# Altium schematic sheet Analog_Project_Mixer_output.SchDoc
size A4; SheetNumber: 2; SheetTotal: 2
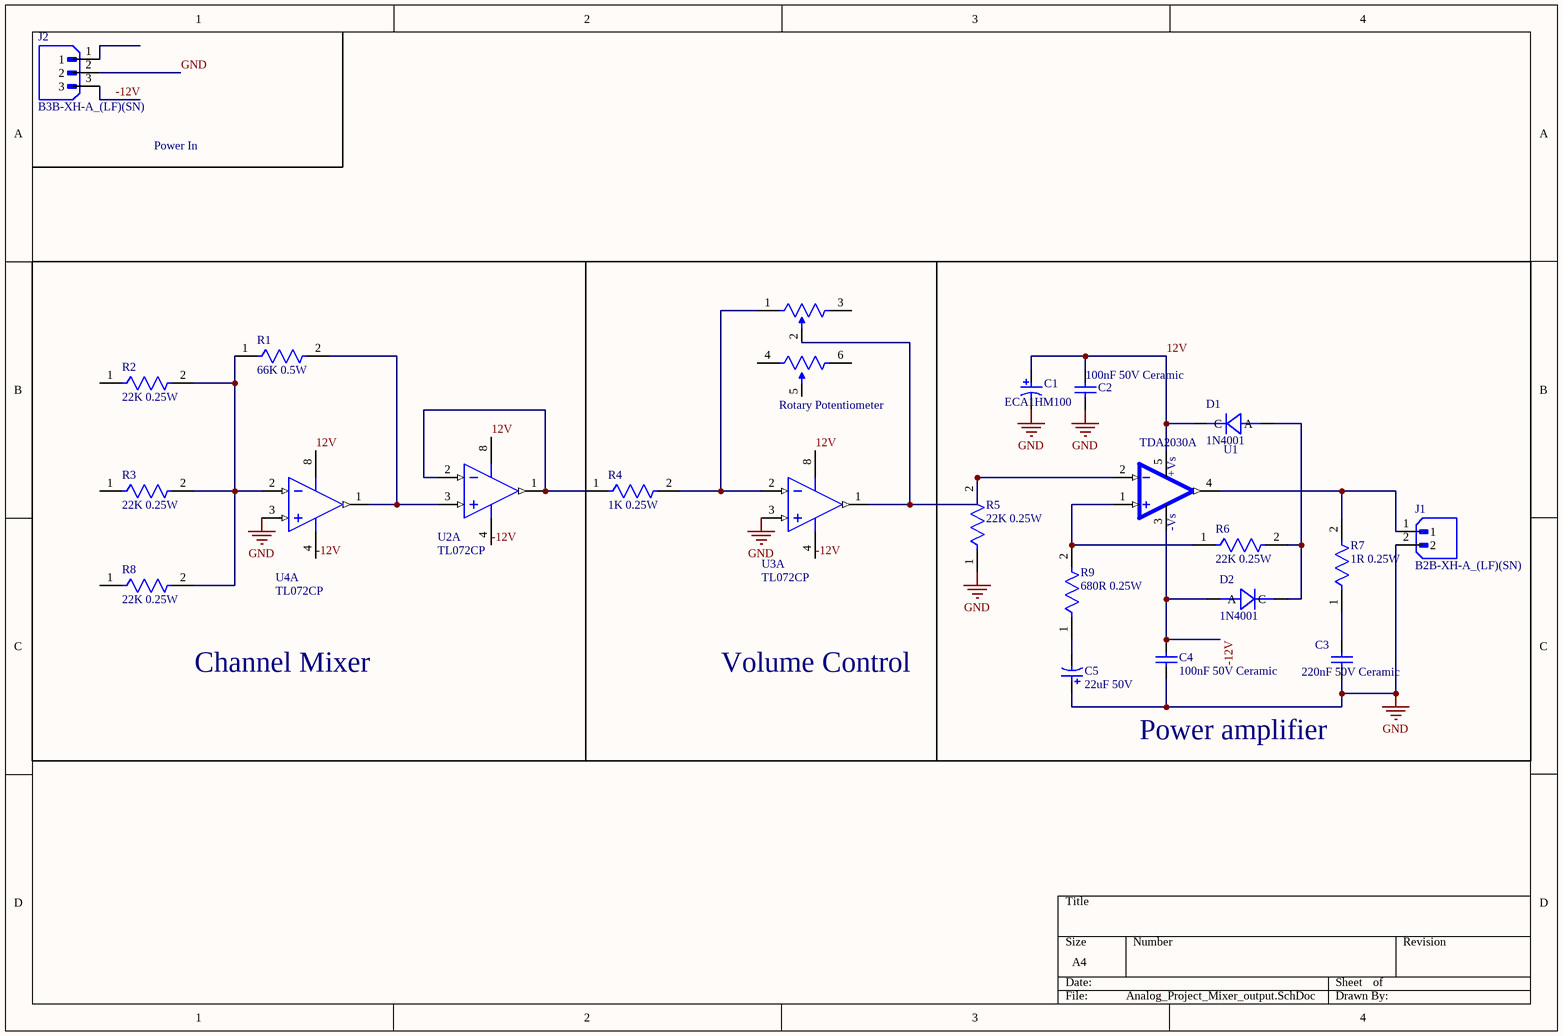
[diagram p0: Analog_Project_Mixer_output.SchDoc]

## Parts
C1  ECA1HM100  [10uF 25V]
C2  100nF 50V Ceramic  [100nF Cap]
C3  220nF 50V Ceramic  [100nF Cap]
C4  100nF 50V Ceramic  [100nF Cap]
C5  22uF 50V  [10uF 25V]
D1  1N4001  [1N400X]
D2  1N4001  [1N400X]
J1  B2B-XH-A_(LF)(SN)  [JST_B2B-XH-A_(LF)(SN)]
J2  B3B-XH-A_(LF)(SN)  [JST_B3B-XH-A (LF)(SN)]
R1  66K 0.5W  [0.5W resistor]
R2  22K 0.25W  [0.25W Carbon film]
R3  22K 0.25W  [0.25W Carbon film]
R4  1K 0.25W  [0.50W Carbon film]
R5  22K 0.25W  [0.25W Carbon film]
R6  22K 0.25W  [0.25W Carbon film]
R7  1R 0.25W  [0.25W Carbon film]
R8  22K 0.25W  [0.25W Carbon film]
R9  680R 0.25W  [0.25W Carbon film]
U1  TDA2030A  [TDA2030A]
U2  TL072CP  [TL072CP_8PDIP]  (part A of 2)
U3  TL072CP  [TL072CP_8PDIP]  (part A of 2)
U4  TL072CP  [TL072CP_8PDIP]  (part A of 2)
Variable1  Rotary Potentiometer  [Rotary Pot Stereo]

## Nets
GND: C1.2 C2.1 C3.1 C4.1 C5.1 J1.2 J2.2 R5.1 U3.3(IN1+) U4.3(IN1+)
12V: C1.1 C2.2 D1.C U1.5(+VS) U2.8(VCC+) U3.8(VCC+) U4.8(VCC+)
-12V: C4.2 D2.A J2.3 U1.3(-VS) U2.4(VCC-) U3.4(VCC-) U4.4(VCC-)
NetC3_2: C3.2 R7.1
NetC5_2: C5.2 R9.1
NetD1_A: D1.A D2.C R6.2
NetJ1_1: J1.1 R7.2 U1.4(OUT)
NetR1_1: R1.1 R2.2 R3.2 R8.2 U4.2(IN1-)
NetR1_2: R1.2 U2.3(IN1+) U4.1(OUT1)
NetR4_1: R4.1 U2.1(OUT1) U2.2(IN1-)
NetR4_2: R4.2 U3.2(IN1-) Variable1.1
NetR5_2: R5.2 U1.2(INV_IN) U3.1(OUT1) Variable1.2(TAP)
NetR6_1: R6.1 R9.2 U1.1(NON_INV_IN)

Not connected (* = marked no-connect by the designer): J2 1; R2 1; R3 1; R8 1; Variable1 3(2) 4(1) 5(TAP) 6(2)

## Notes on the sheet
- Power In
- Channel Mixer
- Volume Control
- Power amplifier
- (in symbol TDA2030A) +Vs; -Vs

## Library data of the parts
C1 = 100uF 25V: Aluminum Electrolytic Capacitor, 10 uF, +/- 20%, 50 V, -40 to 85 degC, 2-Pin THD, RoHS, Bulk; Manufacturer: Panasonic; Life (Hours): 2000Hour; Lead/Base Style: Straight; Dissipation Factor: 0.12%; Capacitance: 10uF; Leakage Current: 3uA; Dielectric Material: Aluminium; Lead Diameter: 0.5mm; Voltage Rating: 50V; Ripple Current: 65mA; Package Reference: CAPPR55-200-1100X500X1200; Height: 11mm; Diameter: 5mm; REACH SVHC: NoSVHC; Mount: ThroughHole; Packaging: Bulk; Manufacturer URL: http://www.panasonic.com/; Termination: Radial; Datasheet URL: https://industrial.panasonic.com/cdbs/www-data/pdf/RDF0000/ABA0000C1218.pdf; Lead Free: LeadFree; Height - Seated (Max): 0.472inch; Case/Package: Radial; Package Description: 2-Pin Radial Lead, Dia 5 mm, Height 12 mm; Tolerance: 20%; Datasheet Version: Rev. 05, 10/2016; Package Quantity: 200; Ripple Current (AC): 65mA; Min Operating Temperature: -40degC; RoHSCompliant: true; Number of Pins: 2; Max Operating Temperature: 85degC; Voltage: 50V; Lead Pitch: 2mm; Radiation Hardening: No; Voltage Rating (DC): 50V; Length: 11mm
C2 C4 = 100nF 50V Ceramic: Ceramic Capacitor, 100 nF, +/- 10%, 50 V, -55 to 125 degC, 2-Pin THD, RoHS, Tape and Reel; Manufacturer: Vishay; Other Names: BC1084CT; Catalog Drawings: Mono-KapSide2-15_5.58Mono-KapSide1_15; Temperature Coefficient: X7R; Online Catalog: Mono-Kap™Series; Capacitance: 0.1µF; Size / Dimension: 0.157"Lx0.098"W(4.00mmx2.50mm); Operating Temperature: -55°C~125°C; Family: CeramicCapacitors; Manufacturer URL: http://www.vishay.com/; Standard Package: 1; Thickness (Max): -; Ratings: -; Datasheet Version: 08/2013; Package Description: 2-Pin Through Hole Device, Body 4 x 2.6 mm; Mounting Type: ThroughHole; Features: -; Lead Spacing: 0.098"(2.50mm); Tolerance: ±10%; Category: Capacitors; Mounting Technology: ThroughHole; Voltage - Rated: 50V; Lead Style: Straight; Datasheet URL: http://www.vishay.com/docs/45171/kseries.pdf; Applications: GeneralPurpose; Package / Case: Radial; Height - Seated (Max): 0.220"(5.58mm); Package Reference: K104K15X7RF5TL2; Series: Mono-Kap™K; Packaging: CutTape(CT)
C3 = 220nF 50V Ceramic: Ceramic Capacitor, 100 nF, +/- 10%, 50 V, -55 to 125 degC, 2-Pin THD, RoHS, Tape and Reel; Manufacturer: Vishay; Other Names: BC1084CT; Catalog Drawings: Mono-KapSide2-15_5.58Mono-KapSide1_15; Temperature Coefficient: X7R; Online Catalog: Mono-Kap™Series; Capacitance: 0.1µF; Size / Dimension: 0.157"Lx0.098"W(4.00mmx2.50mm); Operating Temperature: -55°C~125°C; Family: CeramicCapacitors; Manufacturer URL: http://www.vishay.com/; Standard Package: 1; Thickness (Max): -; Ratings: -; Datasheet Version: 08/2013; Package Description: 2-Pin Through Hole Device, Body 4 x 2.6 mm; Mounting Type: ThroughHole; Features: -; Lead Spacing: 0.098"(2.50mm); Tolerance: ±10%; Category: Capacitors; Mounting Technology: ThroughHole; Voltage - Rated: 50V; Lead Style: Straight; Datasheet URL: http://www.vishay.com/docs/45171/kseries.pdf; Applications: GeneralPurpose; Package / Case: Radial; Height - Seated (Max): 0.220"(5.58mm); Package Reference: K104K15X7RF5TL2; Series: Mono-Kap™K; Packaging: CutTape(CT)
C5 = 22uF 50V: Aluminum Electrolytic Capacitor, 10 uF, +/- 20%, 50 V, -40 to 85 degC, 2-Pin THD, RoHS, Bulk; Manufacturer: Panasonic; Life (Hours): 2000Hour; Lead/Base Style: Straight; Dissipation Factor: 0.12%; Capacitance: 10uF; Leakage Current: 3uA; Dielectric Material: Aluminium; Lead Diameter: 0.5mm; Ripple Current: 65mA; Package Reference: CAPPR55-200-1100X500X1200; Height: 11mm; Diameter: 5mm; REACH SVHC: NoSVHC; Mount: ThroughHole; Packaging: Bulk; Manufacturer URL: http://www.panasonic.com/; Termination: Radial; Datasheet URL: https://industrial.panasonic.com/cdbs/www-data/pdf/RDF0000/ABA0000C1218.pdf; Lead Free: LeadFree; Height - Seated (Max): 0.472inch; Case/Package: Radial; Package Description: 2-Pin Radial Lead, Dia 5 mm, Height 12 mm; Tolerance: 20%; Voltage Rating: 50V; Datasheet Version: Rev. 05, 10/2016; Package Quantity: 200; Ripple Current (AC): 65mA; Min Operating Temperature: -40degC; RoHSCompliant: true; Number of Pins: 2; Max Operating Temperature: 85degC; Voltage: 50V; Lead Pitch: 2mm; Radiation Hardening: No; Voltage Rating (DC): 50V; Length: 11mm
D1 D2 = 1N4001: DIODE, STANDARD, 1A, 50V, DO-204AL-2; Diode Type: Standard Recovery; Diode Config; Manufacturer: Vishay; Manufacturer Part Number: 1N4001-E3/73; MF: Vishay Semiconductor; MP: 1N4007E-E3/64; Element Configuration: Single; Forward Voltage: 1.1V; Max Forward Surge Current (Ifsm): 30A; Max Junction Temperature (Tj): 150°C; Number of Elements: 1; Peak Non-Repetitive Surge Current: 45A; Peak Reverse Current: 5µA; SnapEDA_Link: https://www.snapeda.com/parts/1N4007E-E3/64/Vishay/view-part/?ref=snap; Package: DO-41 Vishay Semiconductor; Value: *; Check_prices: https://www.snapeda.com/parts/1N4007E-E3/64/Vishay/view-part/?ref=eda; Supplier: DigiKey; Supplier Part Number: 1N4001-E3/73GICT-ND; RoHS: Compliant; Category: Rectifier Diodes; Stock: 29129; Pricing: 1=0.15, 10=0.101, 100=0.0827, 500=0.06926 (USD); Average Rectified Current: 1A; China RoHS: Non-Compliant; Contact Plating: Tin; Current: 1A; Forward Current: 1A; Height: 2.7mm; Length: 5.2mm; Lifecycle Status: Production; Max Operating Temperature: 150°C; Max Output current: 1A; Max Repetitive Reverse Voltage (Vrrm): 50V; Max Reverse Voltage (DC): 50V; Max Surge Current: 30A; Min Operating Temperature: -50°C; Mounting Technology: Through Hole; Pins: 2; Number of Terminals: 2; Radiation Hardening: No; REACH SVHC: No; Reverse Standoff Voltage: 50V; Reverse Voltage: 50V; Schedule B: 8541100080, 8541100080|8541100080|8541100080|8541100080|8541100080; Voltage: 50V; Width: 2.7mm; ComponentLink1URL: https://datasheet.octopart.com:443/1N4001-E3-73-Vishay-datasheet-168682104.pdf?src-supplier=Newark; ComponentLink1Description: https://datasheet.octopart.com:443/1N4001-E3-73-Vishay-datasheet-168682104.pdf?src-supplier=Newark; ComponentLink2URL: https://datasheet.octopart.com:443/1N4001-E3-73-Vishay-datasheet-11547366.pdf?src-supplier=Newark; ComponentLink2Description: https://datasheet.octopart.com:443/1N4001-E3-73-Vishay-datasheet-11547366.pdf?src-supplier=Newark; ComponentLink3URL: https://datasheet.octopart.com:443/1N4001-E3-73-Vishay-datasheet-8381009.pdf?src-supplier=Newark; ComponentLink3Description: https://datasheet.octopart.com:443/1N4001-E3-73-Vishay-datasheet-8381009.pdf?src-supplier=Newark; ComponentLink4URL: https://datasheet.octopart.com:443/1N4001-E3-73-Vishay-datasheet-519570.pdf?src-supplier=Newark; ComponentLink4Description: https://datasheet.octopart.com:443/1N4001-E3-73-Vishay-datasheet-519570.pdf?src-supplier=Newark; ComponentLink5URL: https://datasheet.octopart.com:443/1N4001-E3-73-Vishay-datasheet-41303593.pdf?src-supplier=Newark; ComponentLink5Description: https://datasheet.octopart.com:443/1N4001-E3-73-Vishay-datasheet-41303593.pdf?src-supplier=Newark; ComponentLink6URL: https://datasheet.octopart.com:443/1N4001-E3-73-Vishay-datasheet-62317716.pdf?src-supplier=element14+APAC; ComponentLink6Description: https://datasheet.octopart.com:443/1N4001-E3-73-Vishay-datasheet-62317716.pdf?src-supplier=element14+APAC; ComponentLink7URL: https://datasheet.octopart.com:443/1N4001-E3-73-Vishay-datasheet-41195573.pdf?src-supplier=Farnell; ComponentLink7Description: https://datasheet.octopart.com:443/1N4001-E3-73-Vishay-datasheet-41195573.pdf?src-supplier=Farnell; ComponentLink8URL: http://sigma.octopart.com:80/rohs_statement/Vishay-company-15.pdf?src-supplier=Compliance+Statements; ComponentLink8Description: http://sigma.octopart.com:80/rohs_statement/Vishay-company-15.pdf?src-supplier=Compliance+Statements
J1 = B2B-XH-A_(LF)(SN): Connector Header Through Hole 2 position 0.098 (2.50mm); MF: JST Sales; MP: B2B-XH-A (LF)(SN); SnapEDA_Link: https://www.snapeda.com/parts/B2B-XH-A%20(LF)(SN)/JST+Sales+America+Inc./view-part/?ref=snap; Package: None; Value: *; Check_prices: https://www.snapeda.com/parts/B2B-XH-A%20(LF)(SN)/JST+Sales+America+Inc./view-part/?ref=eda
J2 = B3B-XH-A_(LF)(SN): Connector Header Through Hole 3 position 0.098 (2.50mm); MF: JST Sales America Inc.; MP: B3B-XH-A (LF)(SN); SnapEDA_Link: https://www.snapeda.com/parts/B3B-XH-A%20(LF)(SN)/JST+Sales+America+Inc./view-part/?ref=snap; Package: None; Value: *; Check_prices: https://www.snapeda.com/parts/B3B-XH-A%20(LF)(SN)/JST+Sales+America+Inc./view-part/?ref=eda
R1 = 66K 0.5W: RES 66K OHM 5% 1/2W AXIAL; Voltage Rating: 3.5kV; Power Rating: 500mW; Temperature Coefficient: 200ppm/°C; Resistance: 1.2MR; Diameter: 4mm; Max Operating Temperature: 155°C; Military Standard: Not; Reach SVHC Compliant: Yes; Min Operating Temperature: -55°C; Resistance Tolerance: 5%; Resistor Type: Metal Film; Tolerance: 5%; Mount: Through Hole; Construction: Cylindrical; Contact Plating: Tin; Length: 10mm; Termination: Axial; Voltage Rating (DC): 3.5kV; Packaging: Ammo Pack; Radiation Hardening: No; Case/Package: Conformal
R4 = 1K 0.25W: Fixed Resistor, Metal Film, 0.25W, 1000ohm, 250V, 1% +/-Tol, 100ppm/Cel, Through Hole Mount; Manufacturer: Yageo Group; Manufacturer Part Number: MFR-25FBF52-1K; Lead Diameter: 550µm; Lead Length: 28mm; Max Power Dissipation: 250mW; Value: 1kΩ; Temperature Coefficient: 100ppm/°C; Voltage Rating (DC): 200V; Supplier: Avnet; Supplier Part Number: MFR-25FBF52-1K; RoHS: Compliant; Category: Through-Hole Resistors; Stock: 714; Pricing: 1=0.00766, 10=0.00745, 30=0.00726, 50=0.00713, 100=0.00696 (USD); Case/Package: Axial; China RoHS: Compliant; Composition: Metal Film; Diameter: 2.4mm; Lead Free: Lead Free; Length: 6.2992mm; Lifecycle Status: Production; Max Operating Temperature: 155°C; Min Operating Temperature: -55°C; Mounting Technology: Through Hole; Pins: 2; Number of Terminals: 2; Number of Terminations: 2; Packaging: Bulk; Power Dissipation: 250mW; Power Rating: 250mW; REACH SVHC: Yes; Schedule B: 8533210090, 8533210090|8533210090|8533210090|8533210090|8533210090|8533210090|8533210090|8533210090|8533210090|8533210090|8533210090|8533210090|8533210090|8533210090|8533210090|8533210090|8533210090|8533210090|8533210090|8533210090|8533210090|8533210090|8533210090|85; Termination: Axial; Tolerance: 1%; Voltage Rating: 250V; Width: 6.3mm; Working Voltage: 250V; ComponentLink1URL: https://datasheet.octopart.com:443/MFR-25FBF52-1K-Yageo-datasheet-175665672.pdf?src-supplier=IHS; ComponentLink1Description: https://datasheet.octopart.com:443/MFR-25FBF52-1K-Yageo-datasheet-175665672.pdf?src-supplier=IHS; ComponentLink2URL: https://datasheet.octopart.com/MFR-25FBF52-1K-Yageo-datasheet-28066692.pdf; ComponentLink2Description: https://datasheet.octopart.com/MFR-25FBF52-1K-Yageo-datasheet-28066692.pdf; ComponentLink3URL: https://datasheet.octopart.com:443/MFR-25FBF52-1K-Yageo-datasheet-12510115.pdf?src-supplier=Upverter; ComponentLink3Description: https://datasheet.octopart.com:443/MFR-25FBF52-1K-Yageo-datasheet-12510115.pdf?src-supplier=Upverter; ComponentLink4URL: https://datasheet.octopart.com:443/MFR-25FBF52-1K-Yageo-datasheet-165493774.pdf?src-supplier=Future+Electronics; ComponentLink4Description: https://datasheet.octopart.com:443/MFR-25FBF52-1K-Yageo-datasheet-165493774.pdf?src-supplier=Future+Electronics; ComponentLink5URL: https://datasheet.octopart.com:443/MFR-25FBF52-1K-Yageo-datasheet-155367622.pdf?src-supplier=Future+Electronics; ComponentLink5Description: https://datasheet.octopart.com:443/MFR-25FBF52-1K-Yageo-datasheet-155367622.pdf?src-supplier=Future+Electronics; ComponentLink6URL: https://datasheet.octopart.com:443/MFR-25FBF52-1K-Yageo-datasheet-17233670.pdf?src-supplier=Future+Electronics; ComponentLink6Description: https://datasheet.octopart.com:443/MFR-25FBF52-1K-Yageo-datasheet-17233670.pdf?src-supplier=Future+Electronics; ComponentLink7URL: https://datasheet.octopart.com:443/MFR-25FBF52-1K-Yageo-datasheet-137700554.pdf?src-supplier=Future+Electronics; ComponentLink7Description: https://datasheet.octopart.com:443/MFR-25FBF52-1K-Yageo-datasheet-137700554.pdf?src-supplier=Future+Electronics; ComponentLink8URL: http://sigma.octopart.com:80/conflict_mineral_statement/Yageo-company-3.pdf?src-supplier=Compliance+Statements; ComponentLink8Description: http://sigma.octopart.com:80/conflict_mineral_statement/Yageo-company-3.pdf?src-supplier=Compliance+Statements; ComponentLink9URL: http://sigma.octopart.com:80/rohs_statement/Yageo-company-2.pdf?src-supplier=Compliance+Statements; ComponentLink9Description: http://sigma.octopart.com:80/rohs_statement/Yageo-company-2.pdf?src-supplier=Compliance+Statements
U1 = TDA2030A: Amplifier IC 1-Channel (Mono) Class AB 5-PENTAWATT; MF: STMicroelectronics; SnapEDA_Link: https://www.snapeda.com/parts/TDA2030A/STMicroelectronics/view-part/?ref=snap; Package: Pentawatt-5 STMicroelectronics; Value: *; MP: TDA2030A; Check_prices: https://www.snapeda.com/parts/TDA2030A/STMicroelectronics/view-part/?ref=eda
U2-U4 = TL072CP: Dual Low-Noise JFET-Input General-Purpose Operational Amplifier, 7 to 36 V, 0 to 70 degC, 8-pin DIP (P8), Pb-Free (RoHS); Manufacturer: Texas Instruments; Sub Family: General Purpose Amplifier, High Supply Voltage Amplifier (>=30V); Total Supply Voltage(Max)(+5V is 5, +/-5V is 10): 36; Slew Rate(Typ)(V/us): 13; Vn at 1kHz(Typ)(nV/rtHz): 18; GBW(Typ)(MHz): 3; CMRR(Min)(dB): 70; Total Supply Voltage(Min)(+5V is 5, +/-5V is 10): 7; Vio (25C)(Max)(mV): 10; Rating: Catalog; IIB(Max)(pA): 200; Iq per channel(Max)(mA): 2.5; Number of Channels: 2; Mounting Technology: Through Hole; ComponentLink3Description: Package Specification; PartNumber: TL072CP; PackageVersion: 4040082/E, 04/2010; Eco-Plan: Pb-Free (RoHS); DatasheetVersion: SLOS080J; Offset Drift(Typ)(uV/C): 18; ComponentLink3URL: http://www.ti.com/litv/pdf/mpdi001b; PackageDescription: 8-Pin Plastic In-Line, Body 9.59 x 6.35 mm, Pitch 2.54 mm; Code_JEDEC: MS-001; ComponentLink2URL: http://www.ti.com/lit/ds/symlink/tl072.pdf; ComponentLink1Description: Manufacturer URL; ComponentLink2Description: Datasheet; ComponentLink1URL: http://www.ti.com/; PackageReference: P0008A